# Altium schematic sheet Motor Voltage AMP.SchDoc: =DT_SCH_Title
size A4; Organization: Droid Technologies; SheetNumber: 20; SheetTotal: 20
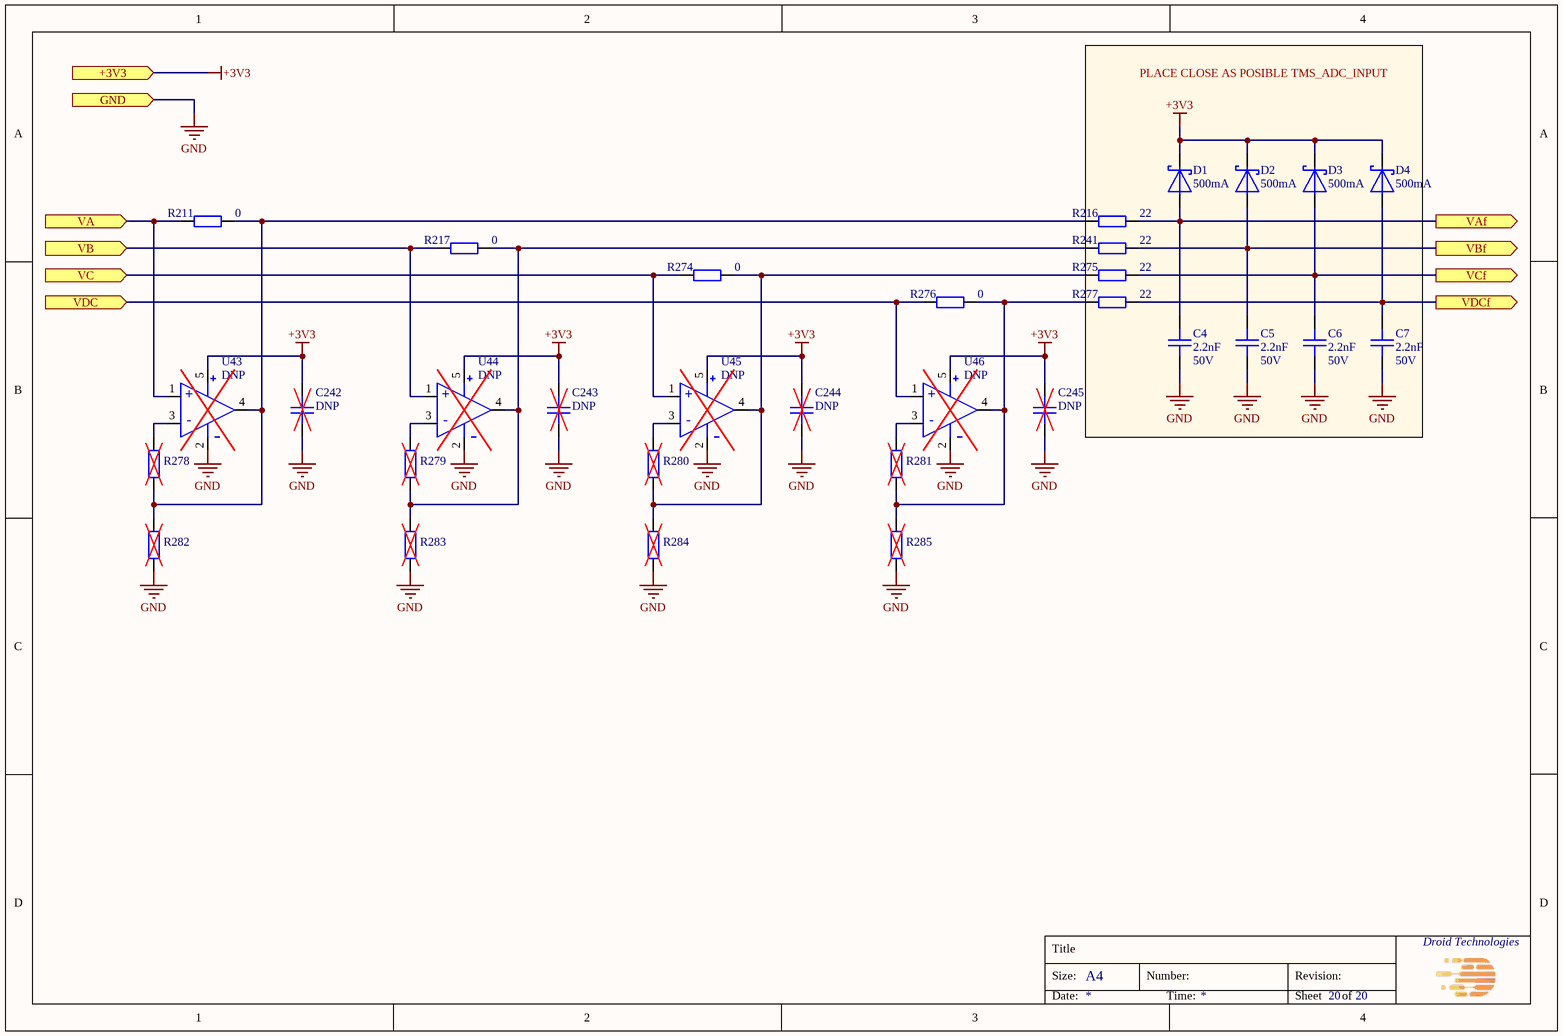
[diagram p0: Motor Voltage AMP.SchDoc]

## Parts
C4  Capacitance: 2.2nF  Voltage Rating: 50V  [CAPC100x50x50L25]  (hidden comment: CGA2B2X8R1H222K050BA)
C5  Capacitance: 2.2nF  Voltage Rating: 50V  [CAPC100x50x50L25]  (hidden comment: CGA2B2X8R1H222K050BA)
C6  Capacitance: 2.2nF  Voltage Rating: 50V  [CAPC100x50x50L25]  (hidden comment: CGA2B2X8R1H222K050BA)
C7  Capacitance: 2.2nF  Voltage Rating: 50V  [CAPC100x50x50L25]  (hidden comment: CGA2B2X8R1H222K050BA)
C242  Capacitance: DNP  [CAPC100x50x50L25]  (hidden comment: DNP chip cap 0402)
C243  Capacitance: DNP  [CAPC100x50x50L25]  (hidden comment: DNP chip cap 0402)
C244  Capacitance: DNP  [CAPC100x50x50L25]  (hidden comment: DNP chip cap 0402)
C245  Capacitance: DNP  [CAPC100x50x50L25]  (hidden comment: DNP chip cap 0402)
D1  Current - Average Rectified (Io): 500mA  [SOD365X155X135L30X57]  (hidden comment: MBR0580S1-7)
D2  Current - Average Rectified (Io): 500mA  [SOD365X155X135L30X57]  (hidden comment: MBR0580S1-7)
D3  Current - Average Rectified (Io): 500mA  [SOD365X155X135L30X57]  (hidden comment: MBR0580S1-7)
D4  Current - Average Rectified (Io): 500mA  [SOD365X155X135L30X57]  (hidden comment: MBR0580S1-7)
R211  Resistance: 0  [RESC100X50X40L25]  (hidden comment: RC0402FR-070RL)
R216  Resistance: 22  [RESC100X50X40L25]  (hidden comment: RC0402FR-0722RL)
R217  Resistance: 0  [RESC100X50X40L25]  (hidden comment: RC0402FR-070RL)
R241  Resistance: 22  [RESC100X50X40L25]  (hidden comment: RC0402FR-0722RL)
R274  Resistance: 0  [RESC100X50X40L25]  (hidden comment: RC0402FR-070RL)
R275  Resistance: 22  [RESC100X50X40L25]  (hidden comment: RC0402FR-0722RL)
R276  Resistance: 0  [RESC100X50X40L25]  (hidden comment: RC0402FR-070RL)
R277  Resistance: 22  [RESC100X50X40L25]  (hidden comment: RC0402FR-0722RL)
R278  DNP chip res 0402  [RESC100X50X40L25]  (value not drawn)
R279  DNP chip res 0402  [RESC100X50X40L25]  (value not drawn)
R280  DNP chip res 0402  [RESC100X50X40L25]  (value not drawn)
R281  DNP chip res 0402  [RESC100X50X40L25]  (value not drawn)
R282  DNP chip res 0402  [RESC100X50X40L25]  (value not drawn)
R283  DNP chip res 0402  [RESC100X50X40L25]  (value not drawn)
R284  DNP chip res 0402  [RESC100X50X40L25]  (value not drawn)
R285  DNP chip res 0402  [RESC100X50X40L25]  (value not drawn)
U43  DNP  [DCK0005A_N]
U44  DNP  [DCK0005A_N]
U45  DNP  [DCK0005A_N]
U46  DNP  [DCK0005A_N]

## Blocks framed on the sheet
PLACE CLOSE AS POSIBLE TMS_ADC_INPUT: C4-C7 D1-D4 R216 R241 R275 R277

## Ports
+3V3 (in), GND (in), VA (in), VAf (out), VB (in), VBf (out), VC (in), VCf (out), VDC (in), VDCf (out)

## Nets
+3V3: C242.2 C243.2 C244.2 C245.2 D1.1 D2.1 D3.1 D4.1 U43.5(+V) U44.5(+V) U45.5(+V) U46.5(+V) ; port +3V3
GND: C4.1 C5.1 C6.1 C7.1 C242.1 C243.1 C244.1 C245.1 R282.1 R283.1 R284.1 R285.1 U43.2(-V) U44.2(-V) U45.2(-V) U46.2(-V) ; port GND
VA: R211.1 U43.1(-) ; port VA
VAf: C4.2 D1.2 R216.2 ; port VAf
VB: R217.1 U44.1(-) ; port VB
VBf: C5.2 D2.2 R241.2 ; port VBf
VC: R274.1 U45.1(-) ; port VC
VCf: C6.2 D3.2 R275.2 ; port VCf
VDC: R276.1 U46.1(-) ; port VDC
VDCf: C7.2 D4.2 R277.2 ; port VDCf
NetR211_2: R211.2 R216.1 R278.1 R282.2 U43.4(OUT)
NetR217_2: R217.2 R241.1 R279.1 R283.2 U44.4(OUT)
NetR274_2: R274.2 R275.1 R280.1 R284.2 U45.4(OUT)
NetR276_2: R276.2 R277.1 R281.1 R285.2 U46.4(OUT)
NetR278_2: R278.2 U43.3(+)
NetR279_2: R279.2 U44.3(+)
NetR280_2: R280.2 U45.3(+)
NetR281_2: R281.2 U46.3(+)

## Notes on the sheet
- Title
- Size:
- A4
- Number:
- Revision:
- Date:
- Time:
- Sheet
- of

## Library data of the parts
C4-C7 = CMP-001-2008-2: CAP CER 2200PF 50V X8R 0402; Manufacturer: TDK Corporation; Op Temp max: 150°C; Tolerance: 10%; Op Temp min: -55°C; Size: 1.00mm x 0.50mm; ComponentLink2URL: https://eu.mouser.com/ProductDetail/TDK/CGA2B2X8R1H222K050BA?qs=NRhsANhppD9e0pyGSMWEuA%3D%3D; Lead Spacing: 0mm; ComponentLink3URL: https://www.digikey.com/en/products/detail/tdk-corporation/CGA2B2X8R1H222K050BA/2443359; Package: 0402 (1005 Metric); Dielectric: X8R; Height max: 550µm; ComponentLink1URL: https://product.tdk.com/en/search/capacitor/ceramic/mlcc/info?part_no=CGA2B2X8R1H222K050BA; ComponentLink1Description: Datasheet; Ratings: AEC-Q200; MPN: CGA2B2X8R1H222K050BA; Mounting Type: SM; ComponentLink2Description: Mouser; ComponentLink3Description: Digikey
C242-C245 = CMP-00427-4: DNP cap 0402; Mounting Type: SM; Package: 0402 (1005 Metric); MPN: DNP
D1-D4 = CMP-001-0960-4: DIODE SCHOTTKY 80V 500MA SOD123; Manufacturer: Diodes Incorporated; Voltage - Forward (Vf) (Max) @ If: 800 mV @ 500 mA; Op Temp max: 175°C; Capacitance: 15pF; Op Temp min: -55°C; Reverse Recovery Time (trr): 0s; Diode Type: Schottky; ComponentLink2URL: https://eu.mouser.com/ProductDetail/Diodes-Incorporated/MBR0580S1-7?qs=jXf%2FRVhl83bQOuXZ5W6icQ%3D%3D; Mounting Type: SM; ComponentLink1Description: Datasheet; MPN: MBR0580S1-7; ComponentLink1URL: https://mm.digikey.com/Volume0/opasdata/d220001/medias/docus/2174/MBR0580S1_R5.pdf; ComponentLink3URL: https://www.digikey.com/en/products/detail/diodes-incorporated/MBR0580S1-7/5080335; Size: 3.65mm x 1.55mm; Voltage - DC Reverse (Vr) (Max): 80V; ComponentLink3Description: Digikey; Package: SOD-123; Height max: 1.35mm; ComponentLink2Description: Mouser
R211 R217 R274 R276 = CMP-001-0208-12: RES SMD 0 OHM JUMPER 1/16W 0402; Manufacturer: YAGEO; Op Temp max: 155°C; Temperature Coefficient: ±100ppm; Op Temp min: -55°C; Tolerance: 0%; Power: 63mW; ComponentLink3URL: https://www.digikey.com/en/products/detail/yageo/RC0402FR-070RL/2827570; ComponentLink1Description: Datasheet; Composition: Thick Film; ComponentLink1URL: https://www.yageo.com/upload/media/product/productsearch/datasheet/rchip/PYu-RC_Group_51_RoHS_L_12.pdf; ComponentLink3Description: Digikey; Size: 1.00mm x 0.50mm; ComponentLink2Description: Mouser; Ratings: -; Package: 0402 (1005 Metric); MPN: RC0402FR-070RL; ComponentLink2URL: https://eu.mouser.com/ProductDetail/YAGEO/RC0402FR-070RL?qs=%2Fha2pyFaduhjtLcYvKXQ8C3M6h5LO%252B8bxxSVLF2BfkIYKpoExpS33A%3D%3D; Height max: 400µm; Mounting Type: SM
R216 R241 R275 R277 = CMP-001-0482-4: RES 22 OHM 1% 1/16W 0402; Manufacturer: YAGEO; Temperature Coefficient: ±100ppm; Op Temp max: 155°C; Op Temp min: -55°C; Power: 63mW; Ratings: -; ComponentLink3URL: https://www.digikey.com/en/products/detail/yageo/RC0402FR-0722RL/726562; ComponentLink2URL: https://eu.mouser.com/ProductDetail/YAGEO/RC0402FR-0722RL?qs=V1yeUXFNrkkRg6zf08ADKQ%3D%3D; MPN: RC0402FR-0722RL; ComponentLink1Description: Datasheet; ComponentLink3Description: Digikey; Tolerance: 1%; Size: 1.00mm x 0.50mm; ComponentLink1URL: https://www.yageo.com/upload/media/product/productsearch/datasheet/rchip/PYu-RC_Group_51_RoHS_L_12.pdf; Composition: Thick Film; ComponentLink2Description: Mouser; Mounting Type: SM; Package: 0402 (1005 Metric); Height max: 400µm
R278-R285 = CMP-001-0271-7: DNP res 0402; Package: 0402 (1005 Metric); Mounting Type: SM; MPN: DNP
U43-U46 = TLV9001IDCKR: Manufacturer: Texas Instruments; Current - Input Bias: 5 pA; Voltage - Input Offset: 400 µV; Current - Supply: 60µA; Current - Output / Channel: 40 mA; Voltage - Supply Span (Min): 1.8 V; Voltage - Supply Span (Max): 5 V; Output Type: Rail-to-Rail; Number of Circuits: 1; Slew Rate: 2V/µs; Gain Bandwidth Product: 1 MHz; Amplifier Type: CMOS; MPN: TLV9001IDCKR; Package: 5-TSSOP, SC-70-5, SOT-353; ComponentLink1Description: Datasheet; ComponentLink1URL: https://www.ti.com/lit/ds/symlink/tlv9001.pdf?HQS=dis-dk-null-digikeymode-dsf-pf-null-wwe&ts=1752240371634&ref_url=https%253A%252F%252Fwww.ti.com%252Fgeneral%252Fdocs%252Fsuppproductinfo.tsp%253FdistId%253D10%2526gotoUrl%253Dhttps%253A%252F%252Fwww.ti.com%252Flit%252Fgpn%252Ftlv9001; ComponentLink2Description: DigiKey; ComponentLink2URL: https://www.digikey.com/en/products/detail/texas-instruments/TLV9001IDCKR/9771968; ComponentLink3Description: Mouser; ComponentLink3URL: https://eu.mouser.com/ProductDetail/Texas-Instruments/TLV9001IDCKR?qs=gTYE2QTfZfQi9B6MdkRepg%3D%3D; Mounting Type: SM; Operating Temperature (MIN): -40°C (TA); Operating Temperature (MAX): +125°C (TA)